# Altium schematic sheet ArduinoUnoQV1.1.SchDoc
size 381 x 381 mm; SheetNumber: 1; SheetTotal: 1
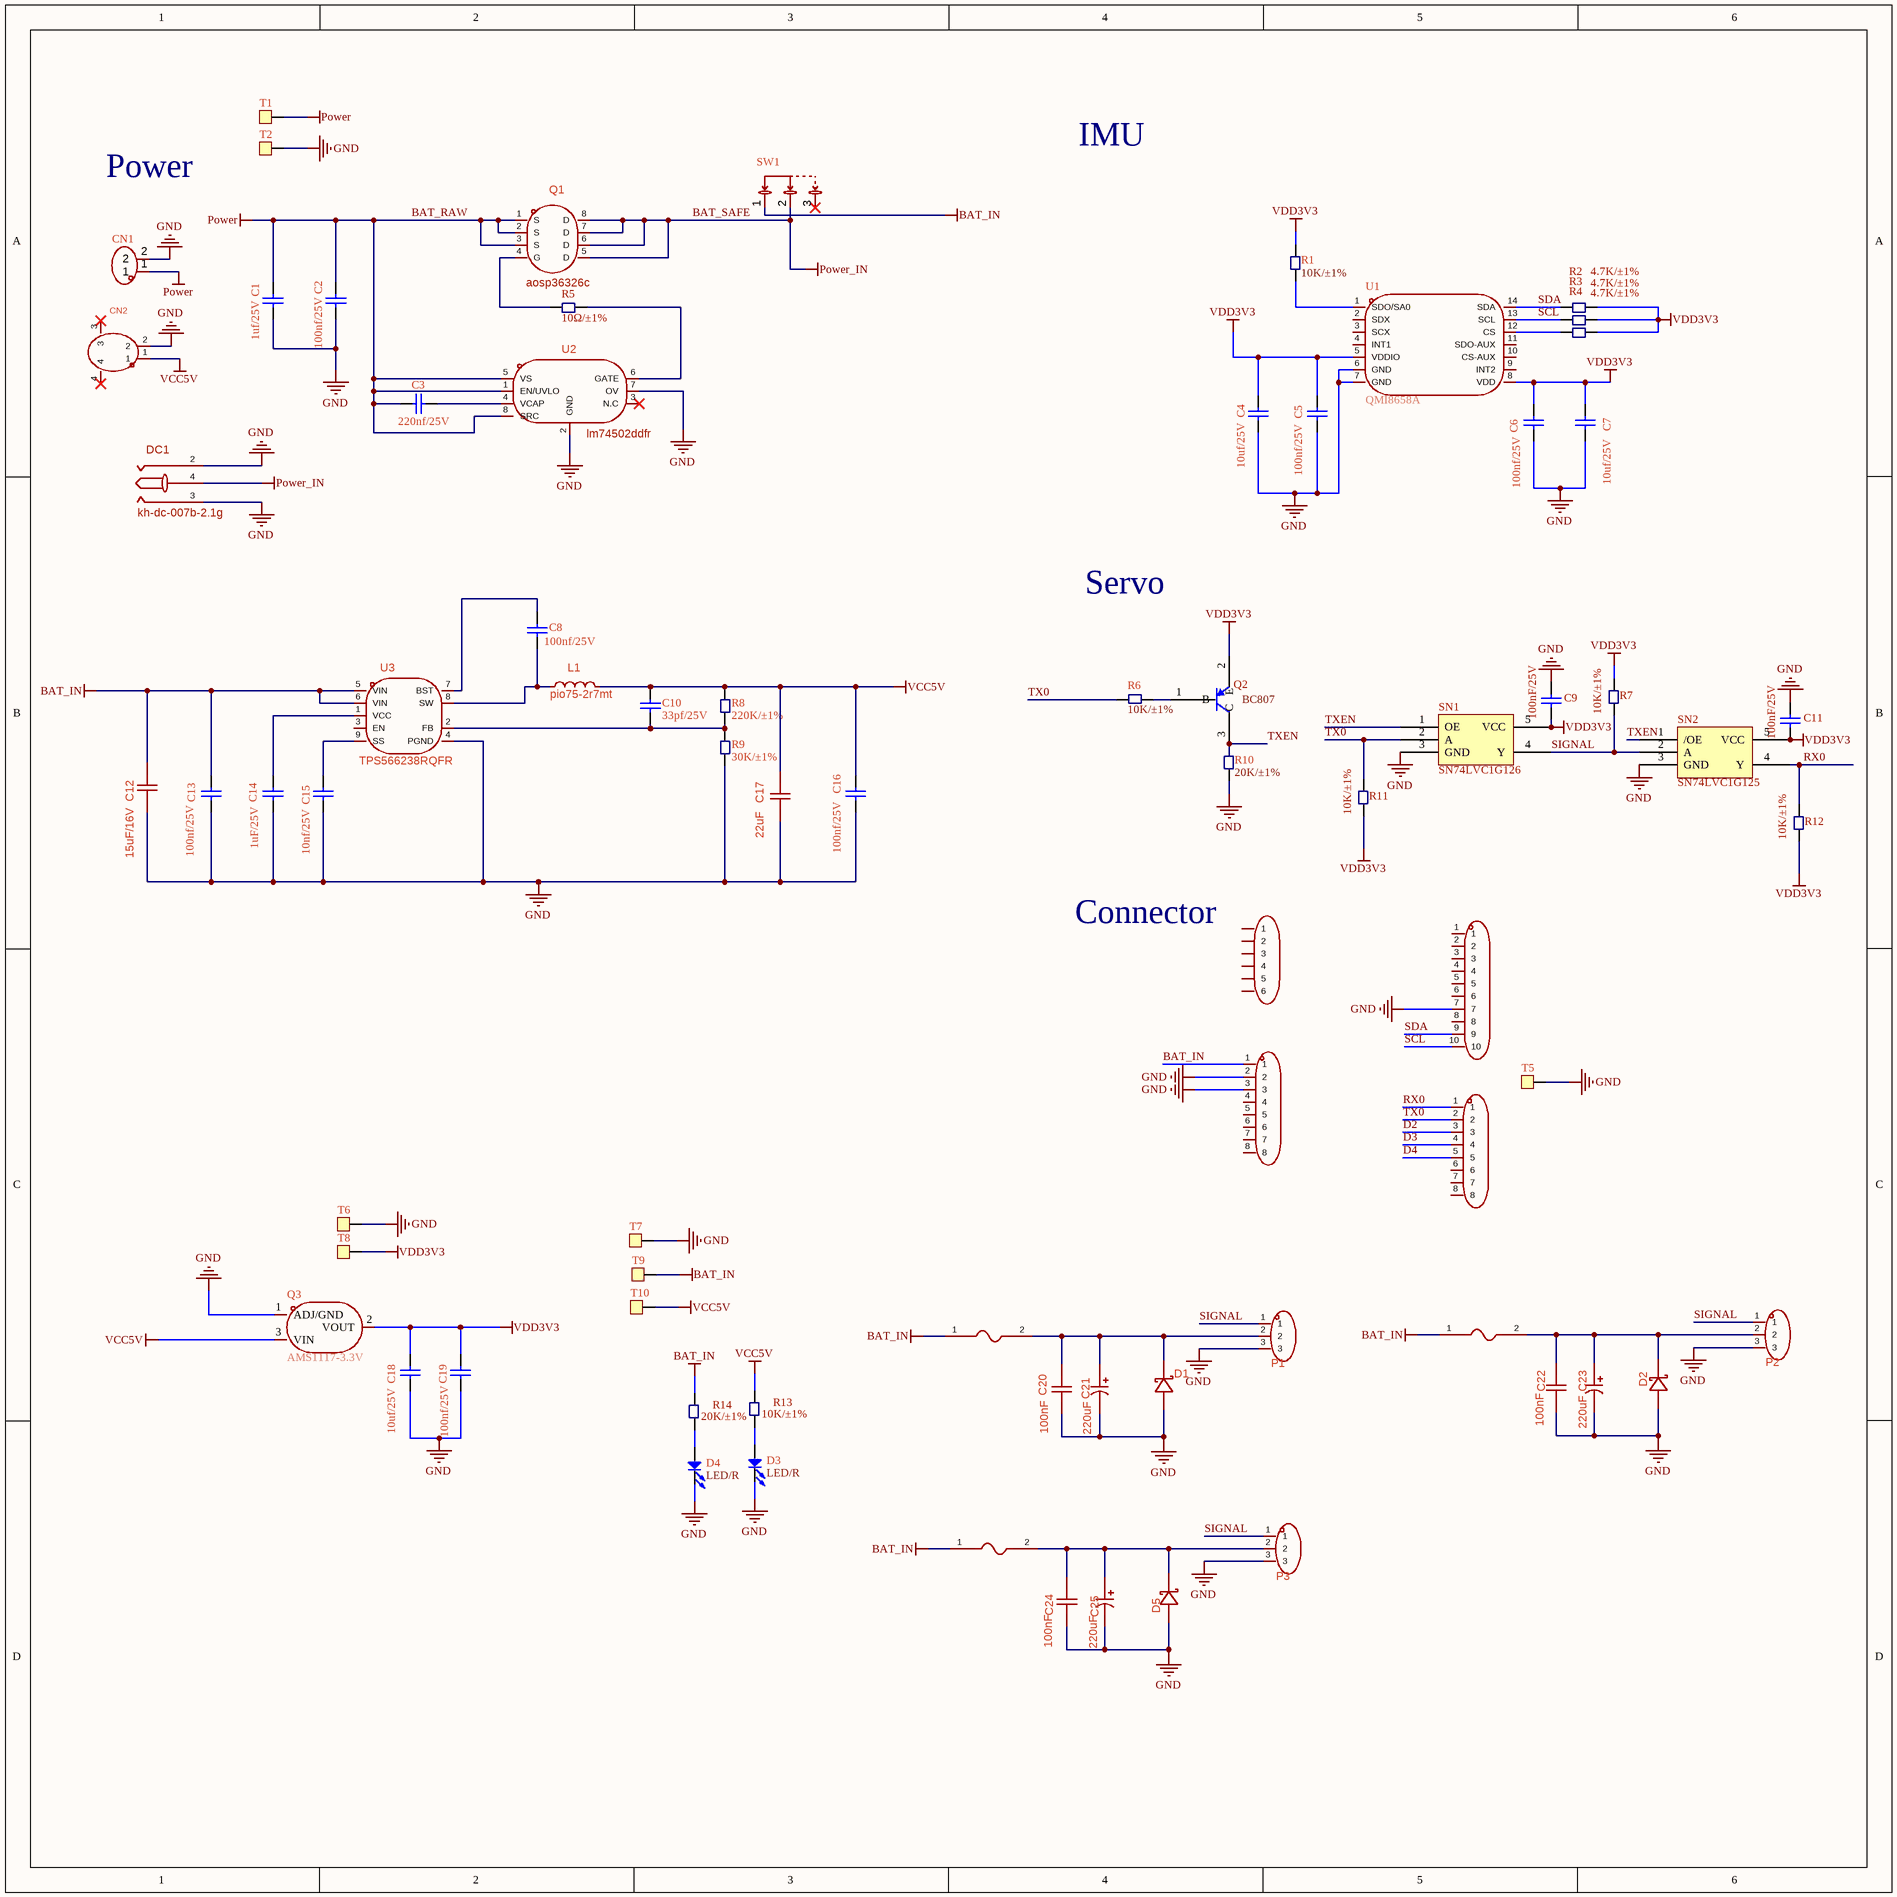
[diagram p0: ArduinoUnoQV1.1.SchDoc]

## Parts
C1  1uf/25V  [C0603]
C2  100nf/25V  [C0603]
C3  220nf/25V  [C0603]
C4  10uf/25V  [C0603]
C5  100nf/25V  [C0603]
C6  100nf/25V  [C0603]
C7  10uf/25V  [C0603]
C8  100nf/25V  [C0603]
C9  100nF/25V  [C0603]
C10  33pf/25V  [C0603]
C11  100nF/25V  [C0603]
C12  15uF/16V  [C0805]
C13  100nf/25V  [C0603]
C14  1uF/25V  [C0603]
C15  10nf/25V  [C0603]
C16  100nf/25V  [C0603]
C17  22uF  [C0805]
C18  10uf/25V  [C0603]
C19  100nf/25V  [C0603]
C20  100nF  [C0805]
C21  value 220uF  [CAP-SMD_BD6.3-L6.6-W6.6-LS7.4-FD]  (hidden comment: rvt1e221m0607)
C22  100nF  [C0805]
C23  value 220uF  [CAP-SMD_BD6.3-L6.6-W6.6-LS7.4-FD]  (hidden comment: rvt1e221m0607)
C24  100nF  [C0805]
C25  value 220uF  [CAP-SMD_BD6.3-L6.6-W6.6-LS7.4-FD]  (hidden comment: rvt1e221m0607)
CN1  ZX-XH2.54-2PWZ  [CONN-TH_2P-P2.50_ZX-XH2.54-2PWZ]  (value not drawn)
CN2  b2b-ph-sm4-tb(lf)(sn)  [CONN-SMD_B2B-PH-SM4-TB-LF-SN]  (value not drawn)
D1  smbj9.0a-e3/5b  [SMB_L4.3-W3.6-LS5.4-R-RD]  (value not drawn)
D2  smbj9.0a-e3/5b  [SMB_L4.3-W3.6-LS5.4-R-RD]  (value not drawn)
D3  LED/R  [D_SOD_523]
D4  LED/R  [D_SOD_523]
D5  smbj9.0a-e3/5b  [SMB_L4.3-W3.6-LS5.4-R-RD]  (value not drawn)
DC1  kh-dc-007b-2.1g  [DC-IN-TH_KH-DC-007B-2.1G]
F1  smd2920p300tf/15  [F2920]  (value not drawn)
F2  smd2920p300tf/15  [F2920]  (value not drawn)
F3  smd2920p300tf/15  [F2920]  (value not drawn)
H1  pz254v-11-06p  [HDR-TH_6P-P2.54-V-M]  (value not drawn)
H2  pz254v-11-10p  [HDR-TH_10P-P2.54-V-M]  (value not drawn)
H3  pz254v-11-08p  [HDR-TH_8P-P2.54-V-M]  (value not drawn)
H4  pz254v-11-08p  [HDR-TH_8P-P2.54-V-M]  (value not drawn)
L1  pio75-2r7mt  [IND-SMD_L7.8-W7.0-A]
P1  292253-3  [CONN-TH_3P-P2.00_TE_292253-3]  (value not drawn)
P2  292253-3  [CONN-TH_3P-P2.00_TE_292253-3]  (value not drawn)
P3  292253-3  [CONN-TH_3P-P2.00_TE_292253-3]  (value not drawn)
Q1  aosp36326c  [SOIC-8_L4.9-W3.9-P1.27-LS6.0-BL]
Q2  BC807  [SOT-23-3]
Q3  AMS1117-3.3V  [SOT-89-3_L4.5-W2.5-P1.50-LS4.2-BR]
R1  10K/±1%  [R0603]
R2  4.7K/±1%  [R0603]
R3  4.7K/±1%  [R0603]
R4  4.7K/±1%  [R0603]
R5  10Ω/±1%  [R0603]
R6  10K/±1%  [R0603]
R7  10K/±1%  [R0603]
R8  220K/±1%  [R0603]
R9  30K/±1%  [R0603]
R10  20K/±1%  [R0603]
R11  10K/±1%  [R0603]
R12  10K/±1%  [R0603]
R13  10K/±1%  [R0603]
R14  20K/±1%  [R0603]
SN1  SN74LVC1G126  [SOT_23_5]
SN2  SN74LVC1G125  [SOT_23_5]
SW1  SS-12D06L5  [SW-TH_3P-P4.70_L11.1-W12.7]  (value not drawn)
T1  TestPoint  [TsetPoint]  (value not drawn)
T2  TestPoint  [TsetPoint]  (value not drawn)
T5  TestPoint  [TsetPoint]  (value not drawn)
T6  TestPoint  [TsetPoint]  (value not drawn)
T7  TestPoint  [TsetPoint]  (value not drawn)
T8  TestPoint  [TsetPoint]  (value not drawn)
T9  TestPoint  [TsetPoint]  (value not drawn)
T10  TestPoint  [TsetPoint]  (value not drawn)
U1  QMI8658A  [LGA-14_L3.0-W2.5-P0.50-TL]
U2  lm74502ddfr  [SOT-23-8_L2.9-W1.6-P0.65-LS2.8-BL]
U3  TPS566238RQFR  [QFN-9_L2.0-W1.5-P0.50-TL_TPS566238PRQFR]

## Nets
BAT_IN: C12.2 C13.1 F1.1 F2.1 F3.1 H3.1 R14.1 SW1.1 T9.0 U3.5(VIN) U3.6(VIN)
BAT_RAW: C1.1 C2.1 C3.2 CN1.1 Q1.1(S) Q1.2(S) Q1.3(S) T1.0 U2.1(EN/UVLO) U2.5(VS) U2.8(SRC)  [also labelled Power]
BAT_SAFE: DC1.4 Q1.5(D) Q1.6(D) Q1.7(D) Q1.8(D) SW1.2  [also labelled Power_IN]
GND: C1.2 C2.2 C4.1 C5.1 C6.1 C7.1 C9.2 C11.2 C12.1 C13.2 C14.2 C15.2 C16.2 C17.1 C18.1 C19.1 C20.1 C21.2 C22.1 C23.2 C24.1 C25.2 CN1.2 CN2.2 D1.1(A) D2.1(A) D3.2(K) D4.2(K) D5.1(A) DC1.2 DC1.3 H2.7 H3.2 H3.3 P1.3 P2.3 P3.3 Q3.1(ADJ/GND) R9.1 R10.2 SN1.3(GND) SN2.3(GND) T2.0 T5.0 T6.0 T7.0 U1.6(GND) U1.7(GND) U2.2(GND) U2.7(OV) U3.4(PGND)
VCC5V: C10.1 C16.1 C17.2 CN2.1 L1.2 Q3.3(VIN) R8.2 R13.1 T10.0
VDD3V3: C4.2 C5.2 C6.2 C7.2 C9.1 C11.1 C18.2 C19.2 Q2.2(E) Q3.2(VOUT) R1.1 R2.2 R3.2 R4.2 R7.1 R11.2 R12.2 SN1.5(VCC) SN2.5(VCC) T8.0 U1.5(VDDIO) U1.8(VDD)
D2: H4.3
D3: H4.4
D4: H4.5
RX0: H4.1 R12.1 SN2.4(Y)
SCL: H2.10 R3.1 U1.13(SCL)
SDA: H2.9 R2.1 U1.14(SDA)
SIGNAL: P1.1 P2.1 P3.1 R7.2 SN1.4(Y) SN2.2(A)
TX0: H4.2 R6.2 R11.1 SN1.2(A)
TXEN: Q2.3(C) R10.1 SN1.1(OE) SN2.1(/OE)
NetC3_1: C3.1 U2.4(VCAP)
NetC8_1: C8.1 U3.7(BST)
NetC8_2: C8.2 L1.1 U3.8(SW)
NetC10_2: C10.2 R8.1 R9.2 U3.2(FB)
NetC14_1: C14.1 U3.1(VCC)
NetC15_1: C15.1 U3.9(SS)
NetC20_2: C20.2 C21.1 D1.2(K) F1.2 P1.2
NetC22_2: C22.2 C23.1 D2.2(K) F2.2 P2.2
NetC24_2: C24.2 C25.1 D5.2(K) F3.2 P3.2
NetD3_1: D3.1(A) R13.2
NetD4_1: D4.1(A) R14.2
NetQ1_4: Q1.4(G) R5.1
NetQ2_1: Q2.1(B) R6.1
NetR1_2: R1.2 U1.1(SDO/SA0)
NetR4_1: R4.1 U1.12(CS)
NetR5_2: R5.2 U2.6(GATE)

Not connected (* = marked no-connect by the designer): CN2 3* 4*; H1 1 2 3 4 5 6; H2 1 2 3 4 5 6 8; H3 4 5 6 7 8; H4 6 7 8; SW1 3*; U1 2(SDX) 3(SCX) 4(INT1) 9(INT2) 10(CS-AUX) 11(SDO-AUX); U2 3(N.C)*; U3 3(EN)

## Notes on the sheet
- IMU
- Power
- Servo
- (near H1) Connector

## Library data of the parts
C1-C8 C10 C13-C16 C18 C19 = 0603 C: 0603贴片电容，±10%，50V; Published: 8-Jun-2000; LatestRevisionDate: 17-Jul-2002; LatestRevisionNote: Re-released for DXP Platform.; PackageReference: RAD-0.3; Publisher: Altium Limited; PackageDescription: Radial Cap, Thru-Hole; 2 Leads; 0.3 in Pin Spacing
  C1: Value: 1uf/25V
  C2 C5 C6 C8 C13 C16 C19: Value: 100nf/25V
  C3: Value: 220nf/25V
  C4 C7 C18: Value: 10uf/25V
  C10: Value: 33pf/25V
  C14: Value: 1uF/25V
  C15: Value: 10nf/25V
C9 C11 = 0603 10nF (103) 10% 50V: 0603贴片电容，±10%，50V; ComponentLink1Description: 供应商链接; ComponentLink1URL: http://www.szlcsc.com/product/details_58143.html; Package: 0603; Supplier: LC; SuppliersPartNumber: 100nF/25V
C12 C17 C20 C22 C24 = 0805 C: 精度:±10%;额定电压:50V;温度系数:X7R;; AddInBom: yes; ModelId: 1ba041120af144c991958decab20d241; ModelName: C0805_L2.0-W1.3-H1.3; ModelTransform: 78.74,51.181,0,0,0,0,0,0.0005,0; Tolerance: ±10%; Voltage Rating: 50V; Temperature Coefficient: X7R; LCSC Part Name: 100nF ±10% 50V; Supplier Footprint: 0805; ConvertToPcb: yes; FootprintName: C0805
  C12: Value: 15uF/16V
  C17: Value: 22uF
  C20 C22 C24: Value: 100nF
C21 C23 C25 = rvt1e221m0607: 铝电解电容，220uF，25V，±20%，贴片; Manufacturer: ROQANG(容强); Symbol: RVT1E221M0607_C2918361; AddInBom: yes; ModelId: 1416614ffc1f4b92814ec0fcf834cf2d; ModelTransform: 291.338,259.842,0,180,0,0,-0.004,-0.007,0; Tolerance: ±20%; Voltage Rating: 25V; Ripple Current: 150mA@120Hz; Lifetime: 2000hrs@105℃; LCSC Part Name: 220uF ±20% 25V; SupplierPart: C2918361; ManufacturerPart: RVT1E221M0607; Supplier Footprint: SMD,D6.3xL7.7mm; JLCPCB Part Class: Extended Part; Datasheet: https://atta.szlcsc.com/upload/public/pdf/source/20241024/87413EF5140CF44BEEEC408A2EAB4036.pdf; Supplier: LCSC; ConvertToPcb: yes; FootprintName: CAP-SMD_BD6.3-L6.6-W6.6-LS7.4-FD; ModelName: CAP-SMD_BD6.3-L6.6-W6.6-LS7.4-FD; Equivalent Series Resistance(ESR): -; Diameter: 6.3mm; Height - Seated (Max): 7.7mm; Operating Temperature: -40℃~+105℃
CN1 = ZX-XH2.54-2PWZ: 插针结构:1x2P;间距:2.5mm;安装方式:弯插;参考系列:XH;总PIN数:2P;排数:1;每排PIN数:2;行距:-;额定电流:2A;触头材质:黄铜;触头镀层:锡;工作温度:-25℃~+85℃;; Manufacturer: Megastar(兆星); AddInBom: yes; ModelId: 24f25f0d7a3348c685f49f501f04732c聨0819f05c4eef4c71ace90d822a990e87; ModelTransform: 295.669,300.7868,0,0,0,0,0,-137.795,-133.858; Pins Structure: 1x2P; Pitch: 2.5mm; Reference Series: XH; Number of PINs Per Row: 2; Current Rating: 2A; Voltage Rating: 250V; Plastic Material: PA66; Flame Retardant Rating: UL94V-0; Z-Height of the Board: 5.9mm; X-Length of Bottom Edge on Board (Spacing Line): 7.5mm; Y-Width of Bottom Edge on Board: 7.32mm; Symbol: ZX-XH2.54-2PWZ; Device: ZX-XH2.54-2PWZ; LCSC Part Name: 1x2P 间距:2.5mm 弯插 系列:XH; SupplierPart: C7429641; ManufacturerPart: ZX-XH2.54-2PWZ; Supplier Footprint: 弯插,P=2.5mm; JLCPCB Part Class: Extended Part; Datasheet: https://item.szlcsc.com/datasheet/ZX-XH2.54-2PWZ/8427558.html; Supplier: LCSC; ConvertToPcb: yes; FootprintName: CONN-TH_2P-P2.50_ZX-XH2.54-2PWZ; ModelName: CONN-TH_2P-P2.50_ZX-XH2.54-2PWZ; Mounting Type: 弯插; Number of Pins: 2P; Number of Rows: 1; Row Spacing: -; Contact Material: 黄铜; Contact Plating: 锡; Operating Temperature: -25℃~+85℃; Supplementary Features: -; Color: 白色
CN2 = b2b-ph-sm4-tb(lf)(sn): 插针结构:1x2P;间距:2mm;安装方式:立贴;参考系列:PH;总PIN数:2P;排数:1;每排PIN数:2;行距:-;额定电流:2A;触头材质:铜合金;触头镀层:锡;工作温度:-25℃~+85℃;; Manufacturer: JST; AddInBom: yes; ModelId: 9b69d1ac0a8e4d5d97a608cb85b10e2f; ModelTransform: 314.96,291.338,0,0,0,0,0,-14.528,0; Pins Structure: 1x2P; Pitch: 2mm; Reference Series: PH; Number of PINs Per Row: 2; Current Rating: 2A; Voltage Rating: 100V; Plastic Material: PA; Flame Retardant Rating: UL94V-0; Supplementary Features: 辅助焊脚; Z-Height of the Board: 6.6mm; X-Length of Bottom Edge on Board (Spacing Line): 7.95mm; Y-Width of Bottom Edge on Board: 7mm; Symbol: B2B-PH-SM4-TB (LF)(SN); LCSC Part Name: 1x2P 间距:2mm 立贴 系列:PH; SupplierPart: C160352; ManufacturerPart: B2B-PH-SM4-TB(LF)(SN); Supplier Footprint: SMD,P=2mm; JLCPCB Part Class: Extended Part; Datasheet: https://item.szlcsc.com/datasheet/B2B-PH-SM4-TB(LF)(SN)/171732.html; Supplier: LCSC; ConvertToPcb: yes; FootprintName: CONN-SMD_B2B-PH-SM4-TB-LF-SN; ModelName: CONN-SMD_B2B-PH-SM4-TB-LF-SN; Mounting Type: 立贴; Number of Pins: 2P; Number of Rows: 1; Row Spacing: -; Contact Material: 铜合金; Contact Plating: 锡; Operating Temperature: -25℃~+85℃; Color: 米色
D1 D2 D5 = smbj9.0a-e3/5b: 极性:单向;反向截止电压(Vrwm):9V;钳位电压:15.4V;峰值脉冲电流(Ipp):39A@10/1000us;峰值脉冲功率(Ppp):600W@10/1000us;击穿电压(VBR):11.1V;; Manufacturer: VISHAY(威世); AddInBom: yes; ModelId: 89ecc9465fc8412eb5ba544f68f54b7c; ModelTransform: 214.1728,140.1572,0,0,0,0,0,0,0; Polarity: 单向; Reverse Stand-Off Voltage (Vrwm): 9V; Clamping Voltage: 15.4V; Voltage - Breakdown: 11.1V; Reverse Leakage Current (Ir): 10uA; Number of Channels: 单路; Type: TVS; Symbol: SMBJ9.0A-E3/5B; LCSC Part Name: 单向TVS 9V截止 峰值浪涌电流：39A@10/1000us; SupplierPart: C1974518; ManufacturerPart: SMBJ9.0A-E3/5B; Supplier Footprint: SMB(DO-214AA); JLCPCB Part Class: Extended Part; Datasheet: https://item.szlcsc.com/datasheet/SMBJ9.0A-E3%252F5B/2066056.html; Supplier: LCSC; ConvertToPcb: yes; FootprintName: SMB_L4.3-W3.6-LS5.4-R-RD; ModelName: SMB_L4.3-W3.6-LS5.4-R-RD; Peak Pulse Current (Ipp): 39A@10/1000us; Peak Pulse Power Dissipation (Ppp): 600W@10/1000us; Operating Temperature: -55℃~+150℃
D3 D4 = LED: Typical INFRARED GaAs LED; Published: 8-Jun-2000; LatestRevisionDate: 08-Jul-2005; LatestRevisionNote: Mech Layer 1 removed.; PackageReference: LED-0; Publisher: Altium Limited; PackageDescription: LED; 2 Leads
DC1 = kh-dc-007b-2.1g: 连接器类型:DC电源插座;安装方式:弯插;触点内径:-;触点外径:-;额定电流:3A;额定电压:50V;工作温度:-30℃~+70℃;; Manufacturer: kinghelm(金航标); AddInBom: yes; ModelId: db467a4a132a497c9fa96d37cafb49be; ModelTransform: 511.81,393.7,0,270,0,0,0,90.551,-74.803; Connector Type: DC电源插座; Current Rating: 3A; Voltage Rating (Max): 50V; Body Height: 10mm; Symbol: KH-DC-007B-2.1G; LCSC Part Name: DC电源插座; SupplierPart: C2847175; ManufacturerPart: KH-DC-007B-2.1G; Supplier Footprint: 插件; JLCPCB Part Class: Extended Part; Datasheet: https://item.szlcsc.com/datasheet/KH-DC-007B-2.1G/3043197.html; Supplier: LCSC; ConvertToPcb: yes; FootprintName: DC-IN-TH_KH-DC-007B-2.1G; ModelName: DC-IN-TH_KH-DC-007B-2.1G; Mounting Type: 弯插; Inside Contact Diameter: -; Outside Contact Diameter: -; Length: 13mm; Width: 10.85mm; Operating Temperature: -30℃~+70℃
F1-F3 = smd2920p300tf/15: 耐压(Vmax):-;最大电流(Imax):-;保持电流(Ihold):3A;跳闸电流(Itrip):-;; Manufacturer: RUILON(瑞隆源); AddInBom: yes; ModelId: c20979b6eed84fe694c25fdbe1326c05; ModelName: F2920-1; ModelTransform: 289.7632,201.5744,0,0,0,0,0,0,0; Hold Current: 3A; Symbol: SMD2920P300TF/15; LCSC Part Name: 3.00A 自恢复型; SupplierPart: C20829; ManufacturerPart: SMD2920P300TF/15; Supplier Footprint: 2920; JLCPCB Part Class: Extended Part; Datasheet: https://item.szlcsc.com/datasheet/SMD2920P300TF%252F15/21541.html; Supplier: LCSC; ConvertToPcb: yes; FootprintName: F2920; Voltage - Max: -; Current - Max: -; Trip Current: -; Power Dissipation: -; Resistance - Initial (Ri) (Min): -; Resistance - Post Trip (R1) (Max): -; Time to Trip(Max): -; Operating Temperature: -40℃~+85℃; Length: -; Width: -; Height: -; Pitch: -
H1 = pz254v-11-06p: 插针结构:1x6P;间距:2.54mm;行距:-;圆针/方针:方针;安装方式:直插;排数:单排;总PIN位数:6P;额定电流:3A;额定电压:-;配合针长度:6mm;塑高:2.5mm;端接针长度:3mm;触头材质:黄铜;触头镀层:金;工作温度:-40℃~+105℃;颜色:黑色;; Manufacturer: BOOMELE(博穆精密); ManufacturerPart: 2.54-1x6P直针; Symbol: Header-Male-2.54_1x6; AddInBom: yes; ModelId: 60739dffc9b04830a286435b0fefbd4a; ModelName: HDR2.54-M-LI-1X6P; ModelTransform: 599.999,100,0,0,0,0,0,0,-118.11; Pin Structure: 1x6P; Pitch: 2.54mm; Circluar Pins/Square Pins: 方针; Current Rating: 3A; LCSC Part Name: 1x6P 间距:2.54mm 方针 直插; SupplierPart: C37208; Supplier Footprint: 插件,P=2.54mm; JLCPCB Part Class: Extended Part; Datasheet: https://item.szlcsc.com/datasheet/2.54-1x6P%25E7%259B%25B4%25E9%2592%2588/38187.html; Supplier: LCSC; ConvertToPcb: yes; FootprintName: HDR-TH_6P-P2.54-V-M-1; Row Spacing: -; Mounting Type: 直插; Number of Rows: 单排; Number of Pins: 6P; Voltage Rating (Max): -; Length of Mating Pin: 6mm; Insulation Height: 2.5mm; Length of End Connection Pin: 3mm; Contact Material: 黄铜; Contact Plating: 金; Operating Temperature: -40℃~+105℃; Color: 黑色
H2 = pz254v-11-10p: 插针结构:1x10P;间距:2.54mm;行距:-;圆针/方针:方针;安装方式:直插;排数:单排;总PIN位数:10P;额定电流:3A;额定电压:250V;配合针长度:6mm;塑高:2.5mm;端接针长度:3mm;触头材质:黄铜;触头镀层:-;工作温度:-40℃~+105℃;颜色:黑色;; Manufacturer: XFCN(兴飞); AddInBom: yes; ModelId: 10f3d1cea59e4bb4ba116af9f09c2b9b; ModelName: HDR2.54-M-LI-1X10P; ModelTransform: 999.99796,100,0,0,0,0,0,0,-118.11; Pin Structure: 1x10P; Pitch: 2.54mm; Circluar Pins/Square Pins: 方针; Current Rating: 3A; Voltage Rating (Max): 250V; Symbol: PZ254V-11-10P; LCSC Part Name: 1x10P 间距:2.54mm 方针 直插; SupplierPart: C492409; ManufacturerPart: PZ254V-11-10P; Supplier Footprint: 插件,P=2.54mm; JLCPCB Part Class: Extended Part; Datasheet: https://item.szlcsc.com/datasheet/PZ254V-11-10P/502965.html; Supplier: LCSC; ConvertToPcb: yes; FootprintName: HDR-TH_10P-P2.54-V-M; Row Spacing: -; Mounting Type: 直插; Number of Rows: 单排; Number of Pins: 10P; Length of Mating Pin: 6mm; Insulation Height: 2.5mm; Length of End Connection Pin: 3mm; Contact Material: 黄铜; Contact Plating: -; Operating Temperature: -40℃~+105℃; Color: 黑色
H3 H4 = pz254v-11-08p: 插针结构:1x8P;间距:2.54mm;行距:-;圆针/方针:方针;安装方式:直插;排数:单排;总PIN位数:8P;额定电流:3A;额定电压:250V;配合针长度:6mm;塑高:2.5mm;端接针长度:3mm;触头材质:黄铜;触头镀层:-;工作温度:-40℃~+105℃;颜色:黑色;; Manufacturer: XFCN(兴飞); AddInBom: yes; ModelId: f5b96e27511e49e38545e53df2320202; ModelTransform: 807.87244,98.425,0,0,0,0,0,0,-118.11; Pin Structure: 1x8P; Pitch: 2.54mm; Circluar Pins/Square Pins: 方针; Current Rating: 3A; Voltage Rating (Max): 250V; Symbol: PZ254V-11-08P; LCSC Part Name: 1x8P 间距:2.54mm 方针 直插; SupplierPart: C492407; ManufacturerPart: PZ254V-11-08P; Supplier Footprint: 插件,P=2.54mm; JLCPCB Part Class: Extended Part; Datasheet: https://item.szlcsc.com/datasheet/PZ254V-11-08P/502963.html; Supplier: LCSC; ConvertToPcb: yes; FootprintName: HDR-TH_8P-P2.54-V-M; ModelName: HDR-TH_8P-P2.54-V-M; Row Spacing: -; Mounting Type: 直插; Number of Rows: 单排; Number of Pins: 8P; Length of Mating Pin: 6mm; Insulation Height: 2.5mm; Length of End Connection Pin: 3mm; Contact Material: 黄铜; Contact Plating: -; Operating Temperature: -40℃~+105℃; Color: 黑色
L1 = pio75-2r7mt: 电感值:2.7uH;精度:±20%;额定电流:5A;饱和电流(Isat):-;类型:非屏蔽电感;; Manufacturer: FH(风华); AddInBom: yes; ModelId: 21d5963050a648ee9a1c76620095bef5; ModelTransform: 306.26112,275.66874,0,0,0,0,0,0,0; Value: 2.7uH; Tolerance: ±20%; Current Rating: 5A; DC Resistance(DCR): 23mΩ; Type: 非屏蔽电感; Symbol: PIO75-2R7MT; LCSC Part Name: 2.7uH ±20%; SupplierPart: C2936674; ManufacturerPart: PIO75-2R7MT; Supplier Footprint: SMD,7.8x7mm; JLCPCB Part Class: Extended Part; Datasheet: https://item.szlcsc.com/datasheet/PIO75-2R7MT/3289256.html; Supplier: LCSC; ConvertToPcb: yes; FootprintName: IND-SMD_L7.8-W7.0-A; ModelName: IND-SMD_L7.8-W7.0-A; Current - Saturation(Isat): -
P1-P3 = 292253-3: 插针结构:1x3P;间距:2mm;安装方式:弯插;总PIN数:3P;排数:1;每排PIN数:3;额定电流:4A;触头材质:黄铜;触头镀层:锡;工作温度:-40℃~+105℃;; Manufacturer: TE Connectivity(泰科电子); AddInBom: yes; ModelId: a9520a19719f44d590017de8a7a53ae9; ModelTransform: 307.086,346.456,0,0,0,0,-11.81,-106.299,-125.984; Pins Structure: 1x3P; Pitch: 2mm; Number of PINs Per Row: 3; Current Rating: 4A; Voltage Rating: 125V; Plastic Material: PA66; Flame Retardant Rating: UL94V-0; Z-Height of the Board: 4mm; X-Length of Bottom Edge on Board (Spacing Line): 7.8mm; Y-Width of Bottom Edge on Board: 8.8mm; Symbol: 292253-3; LCSC Part Name: 1x3P 间距:2mm 弯插; SupplierPart: C532003; ManufacturerPart: 292253-3; Supplier Footprint: 弯插,P=2mm; JLCPCB Part Class: Extended Part; Datasheet: https://item.szlcsc.com/datasheet/292253-3/552164.html; Supplier: LCSC; ConvertToPcb: yes; FootprintName: CONN-TH_3P-P2.00_TE_292253-3; ModelName: CONN-TH_3P-P2.00_TE_292253-3; Mounting Type: 弯插; Number of Pins: 3P; Number of Rows: 1; Contact Material: 黄铜; Contact Plating: 锡; Operating Temperature: -40℃~+105℃
Q1 = aosp36326c: 这款N沟道场效应管专为低压大电流应用优化，在30V的耐压架构下实现了10A的持续电流吞吐能力。其核心优势在于9mΩ的极低导通电阻，这一特性显著降低了导通损耗，使得器件在紧凑的PCB布局中也能保持良好的热表现。20V的栅源电压范围确保了驱动电路设计的灵活性与稳健性。该器件非常适合应用于便携式设备的电源管理、锂电池保护电路以及各类DC/DC同步整流模块，能够高效处理负载切换与功率分配任务。; Manufacturer: HXY MOSFET(华轩阳电子); AddInBom: yes; ModelId: e81d2f7d937b4a6ab1dca543ff5d56a4; ModelName: SOIC-8_L4.9-W3.9-H1.7-LS6.0-P1.27; ModelTransform: 192.913,236.22,0,0,0,0,0,0,0; Symbol: AOSP36326C; LCSC Part Name: AOSP36326C; SupplierPart: C54582795; ManufacturerPart: AOSP36326C; Supplier Footprint: SOP-8; JLCPCB Part Class: Extended Part; Datasheet: https://item.szlcsc.com/datasheet/AOSP36326C/57971578.html; Supplier: LCSC; ConvertToPcb: yes; FootprintName: SOIC-8_L4.9-W3.9-P1.27-LS6.0-BL
Q2 = PNP 60V 600mA: hfe=250~600 PNP 电流:500mA 电压:45V; Published: 8-Jun-2000; LatestRevisionDate: 15-Jan-2003; LatestRevisionNote: PCB Footprint 'BCY-W3/D4.7' replaced; DatasheetVersion: 1997; PackageVersion: Sep-1998; PackageReference: TO-92A; Publisher: Altium Limited; PackageDescription: TO, Flat Index; 3 In-Line, Axial Leads; Body Dia. 4.5mm; Leads 0.51 x 0.48 mm (max); ComponentLink1Description: Manufacturer Link; ComponentLink1URL: http://www.fairchildsemi.com/; ComponentLink2Description: Datasheet; ComponentLink2URL: http://www.fairchildsemi.com/ds/2N%2F2N3906.pdf
Q3 = AMS1117-3.3V_SOT89: 输入18V 输出3.3V 1A，SOT-89封装; Manufacturer: MSKSEMI(美森科); Symbol: AMS1117-3.3V_C5120796; Add into BOM: yes; Output Type: 固定; Voltage - Supply: 18V; Output Voltage: 3.3V; Output Current: 1A; Voltage Dropout: 1.4V@(1A); standby current: 12mA; Output Configuration: 正极; Number of Outputs: 1; Device: AMS1117-3.3V_C5120796; LCSC Part Name: 输入18V 输出3.3V 1A; Supplier Part: C5120796; Manufacturer Part: AMS1117-3.3V; Supplier Footprint: SOT-89; JLCPCB Part Class: Extended Part; Datasheet: https://atta.szlcsc.com/upload/public/pdf/source/20240731/7960C38D2F7D4AC8FF3CFA386029A4C5.pdf; Supplier: LCSC; Convert to PCB: yes; Operating Temperature: 0℃~+125℃
R1-R5 R7 R10-R14 = Res2_1: 厚膜电阻  ±1% 100mW; Published: 8-Jun-2000; LatestRevisionDate: 17-Jul-2002; LatestRevisionNote: Re-released for DXP Platform.; PackageReference: AXIAL-0.4; Publisher: Altium Limited
R6 = Res2_1: 厚膜电阻 ±1% 100mW; Published: 8-Jun-2000; LatestRevisionDate: 17-Jul-2002; LatestRevisionNote: Re-released for DXP Platform.; PackageReference: AXIAL-0.4; Publisher: Altium Limited
R8 R9 = 0603 R: 电阻类型:厚膜电阻;阻值:10kΩ;精度:±1%;功率:100mW;工作电压:75V;温度系数:±100ppm/℃;; Published: 8-Jun-2000; LatestRevisionDate: 17-Jul-2002; LatestRevisionNote: Re-released for DXP Platform.; PackageReference: AXIAL-0.4; Publisher: Altium Limited
SN1 = SN74LVC1G126: 三态输出，单路总线缓冲门
SN2 = SN74LVC1G125: 单总线缓冲门，带三态输出
SW1 = SS-12D06L5: 电路结构:单刀双掷;安装方式:-;开关颜色:黑色;额定电流:3A;额定电压:125V;工作寿命:1万次;; Manufacturer: XKB Connection(中国星坤); AddInBom: yes; ModelId: cdc951e5f4794e0cacc9ea6ffda3ed7a聨0819f05c4eef4c71ace90d822a990e87; ModelTransform: 509.842,582.67596,0,0,0,0,0,-265.748,-145.669; Circuit: 单刀双掷; Actuator Style: 矩形柱状; Switch Height: 6.3mm; Actuator Color: 黑色; Current Rating: 3A; Voltage Rating: 125V; Life: 1万次; Symbol: SS-12D06L5; Device: SS-12D06L5; LCSC Part Name: 柄长5mm 卧插双档 滑动开关; SupplierPart: C319015; ManufacturerPart: SS-12D06L5; Supplier Footprint: 插件,13x6.6mm; JLCPCB Part Class: Extended Part; Supplier: LCSC; ConvertToPcb: yes; FootprintName: SW-TH_3P-P4.70_L11.1-W12.7; ModelName: SW-TH_3P-P4.70_L11.1-W12.7; Termination Style: PC引脚; Length: 12.95mm; Width: 6.6mm; Mounting Type: -; Operating Temperature: -40℃~+85℃
T1 T2 T5-T10 = TestPoint: 测试点
U1 = QMI8658A: 六轴陀螺仪  陀螺仪量程(MAX) ±2048dps  加速度计量程(MAX) ±16g; Symbol: QMI8658A_C3021082
U2 = lm74502ddfr: 类型:高侧开关;输入控制逻辑:高电平有效;工作电压:3.2V~65V;导通电阻:2Ω;; Manufacturer: TI(德州仪器); AddInBom: yes; ModelId: dee2381274cf43f7a1d90e9872eb6b7d; ModelName: TSOT-23-8_L2.9-W1.6-H1.1-LS2.8-P0.65; ModelTransform: 110.45568,114.173,0,90,0,0,0,0,0; Control Input Logic: 高电平有效; RDS(on): 2Ω; Symbol: LM74502DDFR; LCSC Part Name: 具有反极性保护和过压保护功能的低IQ高侧开关控制器; SupplierPart: C3236215; ManufacturerPart: LM74502DDFR; Supplier Footprint: TSOT-23-8; JLCPCB Part Class: Extended Part; Datasheet: https://www.ti.com/cn/lit/ds/symlink/lm74502.pdf; Supplier: LCSC; ConvertToPcb: yes; FootprintName: SOT-23-8_L2.9-W1.6-P0.65-LS2.8-BL; Type: 高侧开关; Voltage - Supply: 3.2V~65V; Features: 集成电荷泵；反向电压保护；过压保护；欠压锁定; Operating Temperature	-: -40℃~+125℃
U3 = TPS566238RQFR: 功能类型:降压型;工作电压:3V~18V;输出电压:600mV~7V;输出电流:6A;输出类型:可调;; Manufacturer: TI(德州仪器); AddInBom: yes; ModelId: d5b77374c11b41a3abc29fe8bcfd3725; ModelTransform: 79.527,59.8424,0,0,0,0,0,-3.465,0; Function: 降压型; Voltage - Supply: 3V~18V; Output Current: 6A; Frequency - Switching: 600kHz; Synchronous Rectifier: 是; Number of Outputs: 1; Topology: 降压式; Switch tube (built-in/external): 内置; Output Type: 可调; Symbol: TPS566238RQFR; LCSC Part Name: 降压型 6A 3V~18V; SupplierPart: C2876603; ManufacturerPart: TPS566238RQFR; Supplier Footprint: VQFN-9-HR(1.5x2); JLCPCB Part Class: Extended Part; Datasheet: https://www.ti.com/cn/lit/ds/symlink/tps566238.pdf; Supplier: LCSC; ConvertToPcb: yes; FootprintName: QFN-9_L2.0-W1.5-P0.50-TL_TPS566238PRQFR; ModelName: QFN-9_L2.0-W1.5-P0.50-TL_TPS566238PRQFR; Output Voltage: 600mV~7V; Operating Temperature: -40℃~+125℃@(TJ); Quiescent Current: -; Features: 逐波限流；可调软启动；过流保护；输出放电；工作状态指示